# Altium schematic sheet SP3485EN-L_TR.schdoc
size 127 x 101 mm
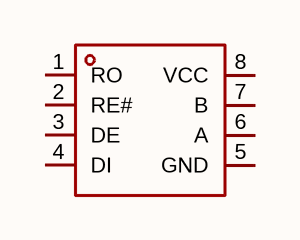
[diagram p0: SP3485EN-L_TR.schdoc]

## Parts
U?  sp3485en-l/tr  [SOIC-8_L5.0-W4.0-P1.27-LS6.0-BL]  (value not drawn)

## Nets

Not connected (* = marked no-connect by the designer): U? 1(RO) 2(RE#) 3(DE) 4(DI) 5(GND) 6(A) 7(B) 8(VCC)

## Library data of the parts
U? = sp3485en-l/tr: 类型:收发器;数据速率:10Mbps;; Manufacturer: MaxLinear(迈凌); AddInBom: yes; ModelId: 7abc64c95a1a4a04a4ef38f9097c870b; ModelTransform: 192.913,236.22,0,0,0,0,0,0,0; Number of Drivers: 1; Voltage - Supply: 3.3V; Data Rate: 10Mbps; Number of Nodes: 32; Quiescent Supply Current: 2mA; Communication Mode: 半双工; Symbol: SP3485EN-L/TR; LCSC Part Name: SP3485 +3.3V低功耗半双工RS-485收发器，数据速率10Mbps; SupplierPart: C8963; ManufacturerPart: SP3485EN-L/TR; Supplier Footprint: SOIC-8; JLCPCB Part Class: Basic Part; Datasheet: https://item.szlcsc.com/datasheet/SP3485EN-L%252FTR/9482.html; Supplier: LCSC; ConvertToPcb: yes; FootprintName: SOIC-8_L5.0-W4.0-P1.27-LS6.0-BL; ModelName: SOIC-8_L5.0-W4.0-P1.27-LS6.0-BL; Type: 收发器; Number of Receivers: 1; ESD Protect: -; Operating Temperature: -40℃~+85℃; Features: Tx/Rx启用；使能关断；过流保护